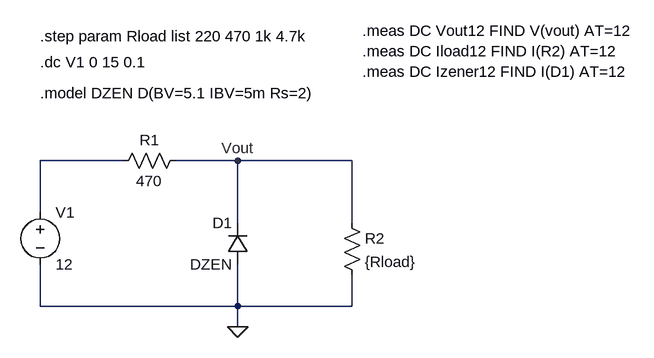
[diagram p0: schematic W02_D06_Zener_VoltageRegulator.asc]
W02_D06_Zener_VoltageRegulator.asc, the LTspice schematic file:
Version 4.1
SHEET 1 1020 680
WIRE 208 48 80 48
WIRE 384 48 288 48
WIRE 560 48 384 48
WIRE 80 128 80 48
WIRE 384 144 384 48
WIRE 560 144 560 48
WIRE 80 272 80 208
WIRE 384 272 384 208
WIRE 384 272 80 272
WIRE 560 272 560 224
WIRE 560 272 384 272
WIRE 384 304 384 272
FLAG 384 48 Vout
FLAG 384 304 0
SYMBOL voltage 80 112 R0
WINDOW 123 0 0 Left 0
WINDOW 39 0 0 Left 0
SYMATTR InstName V1
SYMATTR Value 12
SYMBOL res 304 32 R90
WINDOW 0 0 56 VBottom 2
WINDOW 3 32 56 VTop 2
SYMATTR InstName R1
SYMATTR Value 470
SYMBOL diode 400 208 R180
WINDOW 0 24 64 Left 2
WINDOW 3 24 0 Left 2
SYMATTR InstName D1
SYMATTR Value DZEN
SYMBOL res 544 128 R0
SYMATTR InstName R2
SYMATTR Value {Rload}
TEXT 80 -56 Left 2 !.model DZEN D(BV=5.1 IBV=5m Rs=2)
TEXT 80 -104 Left 2 !.dc V1 0 15 0.1
TEXT 80 -144 Left 2 !.step param Rload list 220 470 1k 4.7k
TEXT 576 -152 Left 2 !.meas DC Vout12 FIND V(vout) AT=12\n.meas DC Iload12 FIND I(R2) AT=12\n.meas DC Izener12 FIND I(D1) AT=12

The netlist it stands for:
* W02_D06_Zener_VoltageRegulator.asc
V1 N001 0 12
R1 Vout N001 470
D1 0 Vout DZEN
R2 Vout 0 {Rload}
.model D D
.lib standard.dio
.model DZEN D(BV=5.1 IBV=5m Rs=2)
.dc V1 0 15 0.1
.step param Rload list 220 470 1k 4.7k
.meas DC Vout12 FIND V(vout) AT=12
.meas DC Iload12 FIND I(R2) AT=12
.meas DC Izener12 FIND I(D1) AT=12
.backanno
.end